# Altium schematic sheet 7''_LCD_Connector.SchDoc
size A4; DocumentNumber: 20; SheetNumber: 20; SheetTotal: 28
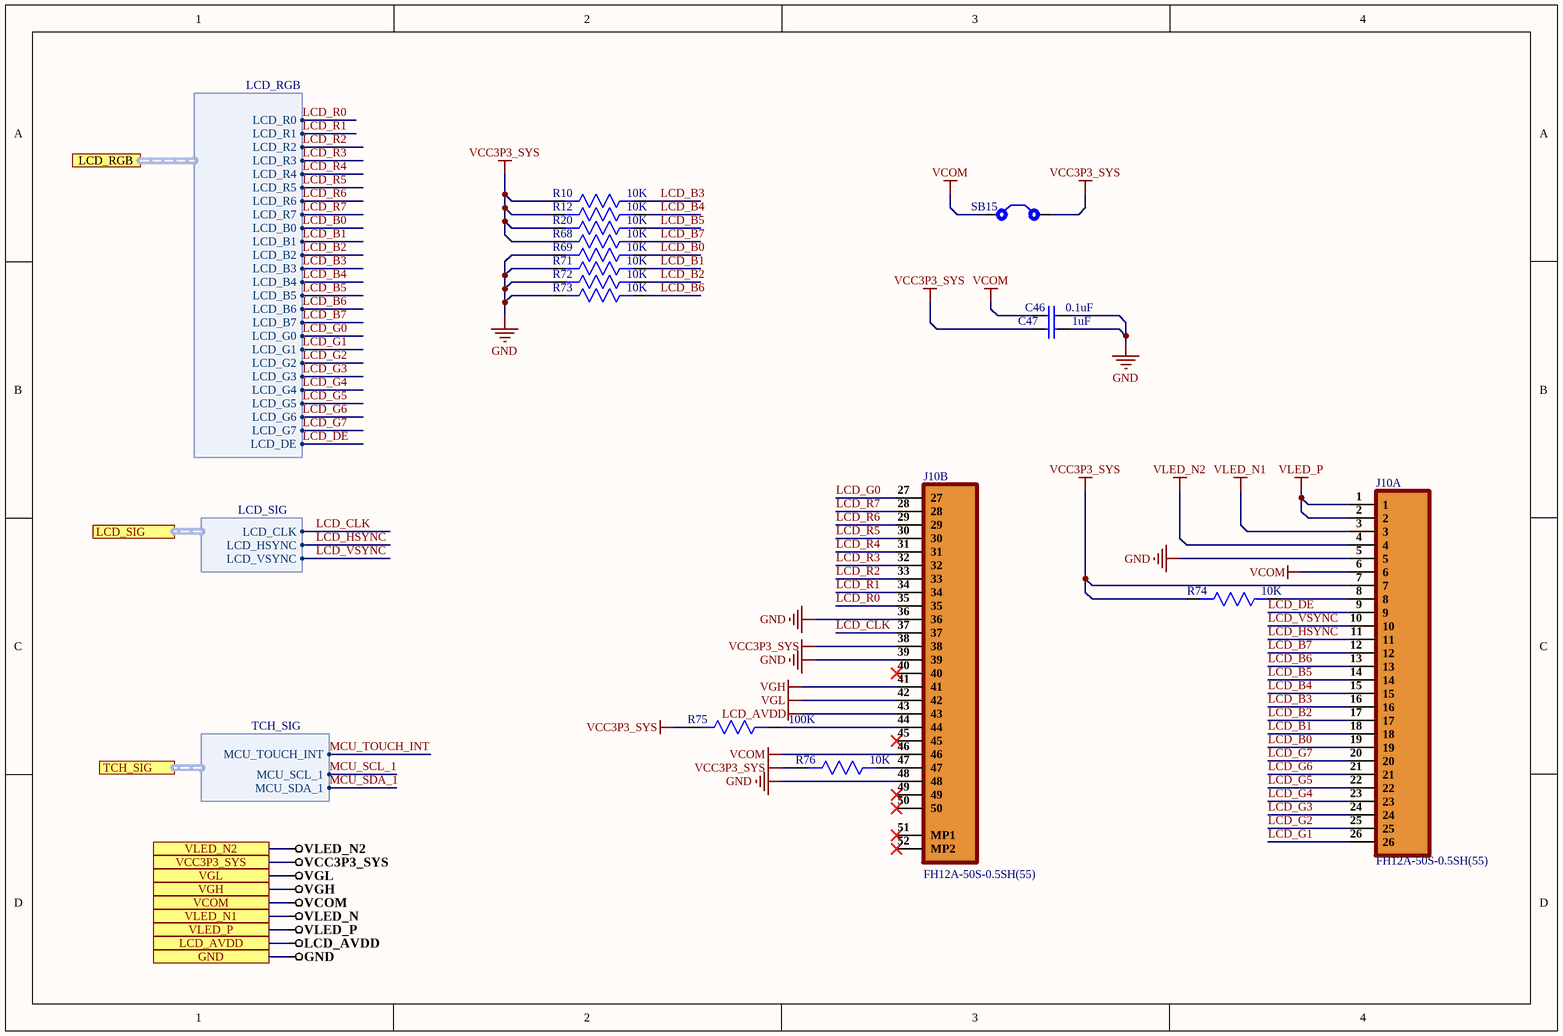
[diagram p0: 7''_LCD_Connector.SchDoc]

## Parts
C46  0.1uF  [Cap0603]
C47  1uF  [Cap0603]
J10  FH12A-50S-0.5SH(55)  [FH12A-50S-0.5SH(55)]  (parts A,B of 2)
R10  10K  [Res0603]
R12  10K  [Res0603]
R20  10K  [Res0603]
R68  10K  [Res0603]
R69  10K  [Res0603]
R71  10K  [Res0603]
R72  10K  [Res0603]
R73  10K  [Res0603]
R74  10K  [Res0603]
R75  100K  [Res0603]
R76  10K  [Res0603]
SB15  Solder Bridge  [Solder Bridge]  (value not drawn)

## Ports
GND, LCD_AVDD, LCD_RGB (harness LCD_RGB), LCD_SIG (harness LCD_SIG), TCH_SIG (harness TCH_SIG), VCC3P3_SYS, VCOM, VGH, VGL, VLED_N1, VLED_N2, VLED_P

## Harnesses
LCD_RGB: LCD_R0, LCD_R1, LCD_R2, LCD_R3, LCD_R5, LCD_R7, LCD_R6, LCD_R4, LCD_B0, LCD_B2, LCD_B4, LCD_B5, LCD_B6, LCD_B7, LCD_B3, LCD_B1, LCD_G0, LCD_G1, LCD_G2, LCD_G3, LCD_G4, LCD_G5, LCD_G6, LCD_G7, LCD_DE
TCH_SIG: MCU_TOUCH_INT, MCU_SCL_1, MCU_SDA_1
LCD_SIG: LCD_CLK, LCD_HSYNC, LCD_VSYNC

## Nets
GND: C46.2 C47.2 J10.5 J10.36 J10.39 J10.48 R69.2 R71.2 R72.2 R73.2 ; port GND
LCD_AVDD: J10.43 ; port LCD_AVDD
VCC3P3_SYS: C47.1 J10.7 J10.38 R10.2 R12.2 R20.2 R68.2 R74.2 R75.2 R76.2 SB15.2 ; port VCC3P3_SYS
VCOM: C46.1 J10.6 J10.46 SB15.1 ; port VCOM
VGH: J10.41 ; port VGH
VGL: J10.42 ; port VGL
VLED_N: port VLED_N1
VLED_N1: J10.3
VLED_N2: J10.4 ; port VLED_N2
VLED_P: J10.1 J10.2 ; port VLED_P
LCD_B0: J10.19 R69.1 ; port LCD_RGB.LCD_B0
LCD_B1: J10.18 R71.1 ; port LCD_RGB.LCD_B1
LCD_B2: J10.17 R72.1 ; port LCD_RGB.LCD_B2
LCD_B3: J10.16 R10.1 ; port LCD_RGB.LCD_B3
LCD_B4: J10.15 R12.1 ; port LCD_RGB.LCD_B4
LCD_B5: J10.14 R20.1 ; port LCD_RGB.LCD_B5
LCD_B6: J10.13 R73.1 ; port LCD_RGB.LCD_B6
LCD_B7: J10.12 R68.1 ; port LCD_RGB.LCD_B7
LCD_CLK: J10.37 ; port LCD_SIG.LCD_CLK
LCD_DE: J10.9 ; port LCD_RGB.LCD_DE
LCD_G0: J10.27 ; port LCD_RGB.LCD_G0
LCD_G1: J10.26 ; port LCD_RGB.LCD_G1
LCD_G2: J10.25 ; port LCD_RGB.LCD_G2
LCD_G3: J10.24 ; port LCD_RGB.LCD_G3
LCD_G4: J10.23 ; port LCD_RGB.LCD_G4
LCD_G5: J10.22 ; port LCD_RGB.LCD_G5
LCD_G6: J10.21 ; port LCD_RGB.LCD_G6
LCD_G7: J10.20 ; port LCD_RGB.LCD_G7
LCD_HSYNC: J10.11 ; port LCD_SIG.LCD_HSYNC
LCD_R0: J10.35 ; port LCD_RGB.LCD_R0
LCD_R1: J10.34 ; port LCD_RGB.LCD_R1
LCD_R2: J10.33 ; port LCD_RGB.LCD_R2
LCD_R3: J10.32 ; port LCD_RGB.LCD_R3
LCD_R4: J10.31 ; port LCD_RGB.LCD_R4
LCD_R5: J10.30 ; port LCD_RGB.LCD_R5
LCD_R6: J10.29 ; port LCD_RGB.LCD_R6
LCD_R7: J10.28 ; port LCD_RGB.LCD_R7
LCD_VSYNC: J10.10 ; port LCD_SIG.LCD_VSYNC
MCU_SCL_1: port TCH_SIG.MCU_SCL_1
MCU_SDA_1: port TCH_SIG.MCU_SDA_1
MCU_TOUCH_INT: port TCH_SIG.MCU_TOUCH_INT
NetJ10_8: J10.8 R74.1
NetJ10_44: J10.44 R75.1
NetJ10_47: J10.47 R76.1

Not connected (* = marked no-connect by the designer): J10 40* 45* 49* 50* 51(MP1)* 52(MP2)*

## Library data of the parts
C46 = CC0603ZRY5V9BB104: CAP CER 0.1UF 50V Y5V 0603; Manufacturer: Yageo; Capacitance: 100nF; Tolerance: 80%; Supplier 1: Digi-Key; Manufacturer Part Number: CC0603ZRY5V9BB104; Stock 1: 15000880; Pricing 1: 1=0.1, 10=0.075, 100=0.0334, 500=0.02386, 1000=0.01874 (USD); Mount: Surface Mount; Case/Package: 0603; Number of Pins: 2; Case Code (Metric): 1608; Case Code (Imperial): 0603; Min Operating Temperature: -30°C; Max Operating Temperature: 85°C; Dielectric: Y5V; Voltage Rating: 50V; Package Quantity: 1; Packaging: Tape and Reel; Voltage Rating (DC): 50V; Termination: SMD/SMT; Composition: Ceramic; Voltage: 50V; Length: 1.6mm; Height: 0.8mm; Width: 0.031inch; Thickness: 0.035inch; Depth: 0.8mm; Radiation Hardening: No; REACH SVHC: No SVHC; Lead Free: Lead Free; Halogen Free: Halogen Free; ComponentLink1URL: http://www.yageo.com/documents/recent/UPY-GPHC_Y5V_6.3V-to-50V_8.pdf?src-supplier=Digi-Key; ComponentLink1Description: http://www.yageo.com/documents/recent/UPY-GPHC_Y5V_6.3V-to-50V_8.pdf?src-supplier=Digi-Key; ComponentLink2URL: http://www.yageo.com/documents/recent/UPY-GPHC_Y5V_6.3V-to-50V_5.pdf?src-supplier=Avnet+Europe; ComponentLink2Description: http://www.yageo.com/documents/recent/UPY-GPHC_Y5V_6.3V-to-50V_5.pdf?src-supplier=Avnet+Europe; ComponentLink3URL: https://www.verical.com/server-webapp/html/getDatasheet?partID=403611&src-supplier=Verical; ComponentLink3Description: https://www.verical.com/server-webapp/html/getDatasheet?partID=403611&src-supplier=Verical; ComponentLink4URL: http://www.mouser.com/ds/2/447/Yageo_UPY-GP_NP0_16V-to-50V_9-358835.pdf?src-supplier=Mouser; ComponentLink4Description: http://www.mouser.com/ds/2/447/Yageo_UPY-GP_NP0_16V-to-50V_9-358835.pdf?src-supplier=Mouser; ComponentLink5URL: http://www.farnell.com/datasheets/1132289.pdf?src-supplier=Element14; ComponentLink5Description: http://www.farnell.com/datasheets/1132289.pdf?src-supplier=Element14; Supplier Part Number 1: 311-1343-1-ND
C47 = CC0603KRX5R8BB105: CAP CER 1UF 25V X5R 0603; Manufacturer: Yageo; Tolerance: 10%; Supplier 1: Digi-Key; Manufacturer Part Number: CC0603KRX5R8BB105; Stock 1: 459947; Pricing 1: 1=0.1, 10=0.076, 100=0.0337, 500=0.0241, 1000=0.01894 (USD); Mount: Surface Mount; Case/Package: 0603; Number of Pins: 2; Case Code (Metric): 1608; Case Code (Imperial): 0603; Min Operating Temperature: -55°C; Max Operating Temperature: 85°C; Capacitance: 1uF; Dielectric: X5R; Package Quantity: 1; Voltage Rating: 25V; Packaging: Tape and Reel; Termination: SMD/SMT; Voltage Rating (DC): 25V; Length: 1.6mm; Height: 0.8mm; Width: 0.031inch; Thickness: 0.035inch; Depth: 0.8mm; Radiation Hardening: No; REACH SVHC: No SVHC; Lead Free: Lead Free; Halogen Free: Halogen Free; ComponentLink1URL: http://www.yageo.com/documents/recent/UPY-GPHC_X5R_4V-to-50V_25.pdf?src-supplier=Digi-Key; ComponentLink1Description: http://www.yageo.com/documents/recent/UPY-GPHC_X5R_4V-to-50V_25.pdf?src-supplier=Digi-Key; ComponentLink2URL: http://www.yageo.com/documents/recent/UPY-GPHC_X5R_4V-to-50V_12.pdf?src-supplier=Avnet+Europe; ComponentLink2Description: http://www.yageo.com/documents/recent/UPY-GPHC_X5R_4V-to-50V_12.pdf?src-supplier=Avnet+Europe; ComponentLink3URL: http://www.farnell.com/datasheets/1525783.pdf?src-supplier=Element14; ComponentLink3Description: http://www.farnell.com/datasheets/1525783.pdf?src-supplier=Element14; ComponentLink4URL: http://www.yageo.com/documents/recent/UPY-GPHC_X5R_4V-to-50V_12.pdf?src-supplier=Avnet; ComponentLink4Description: http://www.yageo.com/documents/recent/UPY-GPHC_X5R_4V-to-50V_12.pdf?src-supplier=Avnet; Supplier Part Number 1: 311-1445-1-ND
J10 = FH12A-50S-0.5SH(55): Conn FFC/FPC 50 POS 0.5mm  SMD T/R; Manufacturer: Hirose; Actuator Material: Polyphenylene; Number of Contacts: 50; Wire/Cable Type: Straight; Gender: Female; Current Rating: 500mA; Voltage Rating: 50V; Contact Resistance: 50mR; Max Current Rating: 400mA; Contact Location: Top; Insulation Resistance: 500MR; Mating Cycles: 20; Supplier 1: Digi-Key; Manufacturer Part Number: FH12A-50S-0.5SH(55); RoHS: Yes; Category: FFC / FPC; Pricing 1: 1=3.00000, 10=2.88000, 25=2.64000, 50=2.52000, 100=2.40000, 250=2.10000, 500=2.04000, 1000=1.74000 (USD); Mount: Surface Mount; Housing Material: Polyamide; Contact Material: Bronze; Contact Plating: Gold; Housing Color: Beige; Material: Polyamide; Color: Beige,Brown; Min Operating Temperature: -40°C; Max Operating Temperature: 70°C; Orientation: Right Angle; Termination: Solder; Number of Rows: 1; Package Quantity: 2000; Packaging: Tape and Reel; Number of Positions: 50; Max Voltage Rating (AC): 50V; Voltage Rating (AC): 50V; Length: 29.5mm; Width: 29.1mm; Pitch: 0.5mm; Depth: 6.2mm; Lead Pitch: 0.5mm; Radiation Hardening: No; Flammability Rating: UL94 V-0; Lead Free: Lead Free; REACH SVHC: No SVHC; ComponentLink1URL: https://datasheet.ciiva.com/14667/0900766b80806912-14667338.pdf?src-supplier=RSComponents; ComponentLink1Description: https://datasheet.ciiva.com/14667/0900766b80806912-14667338.pdf?src-supplier=RSComponents; ComponentLink2URL: https://datasheet.ciiva.com/11745/0900766b80d985fc-11745058.pdf?src-supplier=RSComponents; ComponentLink2Description: https://datasheet.ciiva.com/11745/0900766b80d985fc-11745058.pdf?src-supplier=RSComponents; ComponentLink3URL: https://datasheet.ciiva.com/15176/getdatasheetpartid-447852-15176863.pdf?src-supplier=Verical; ComponentLink3Description: https://datasheet.ciiva.com/15176/getdatasheetpartid-447852-15176863.pdf?src-supplier=Verical; ComponentLink4URL: https://datasheet.ciiva.com/7989/58809-7989413.pdf?src-supplier=Element14; ComponentLink4Description: https://datasheet.ciiva.com/7989/58809-7989413.pdf?src-supplier=Element14; ComponentLink5URL: https://datasheet.ciiva.com/5137/ed-fh12-20140305-355586-5137621.pdf?src-supplier=Mouser; ComponentLink5Description: https://datasheet.ciiva.com/5137/ed-fh12-20140305-355586-5137621.pdf?src-supplier=Mouser; Supplier Part Number 1: HFK150CT-ND
R10 R12 R20 R68 R69 R71-R74 R76 = AC0603JR-0710KL: RES SMD 10K OHM 5% 1/10W 0603; Manufacturer: Yageo; Voltage Rating: 50V; Resistance: 10kR; Power Rating: 100mW; Temperature Coefficient: 100ppm/°C; Supplier 1: Future Electronics; Manufacturer Part Number: AC0603JR-0710KL; RoHS: Yes; Category: Chip SMD Resistors; Stock 1: 1533000; Pricing 1: 5000=0.00540 (USD); Case/Package: 0603; Case Code (Imperial): 0603; Case Code (Metric): 1608; Size Code: 0603; Min Operating Temperature: -55°C; Max Operating Temperature: 155°C; Packaging: Tape and Reel; Tolerance: 5%; Package Quantity: 1; Resistor Type: Thick Film; Termination: SMD/SMT; Number of Terminations: 2; Max Power Dissipation: 100mW; Features: Moisture Resistant,Automotive AEC-Q200,Anti-Sulfur; Series: AC; Construction: Rectangular; Length: 0.063inch; Width: 0.031inch; Height: 0.022inch; Depth: 0.8mm; Military Standard: Not; Lead Free: Lead Free; RoHS Compliant: Yes; ComponentLink1URL: https://datasheet.ciiva.com/5562/pyu-ac-51-rohs-l-2-5562553.pdf?src-supplier=Mouser; ComponentLink1Description: https://datasheet.ciiva.com/5562/pyu-ac-51-rohs-l-2-5562553.pdf?src-supplier=Mouser; Supplier Part Number 1: 1029044
R75 = CRGH0603J100K: RES SMD 100K OHM 5% 1/5W 0603; Manufacturer: TE Connectivity; Resistance: 100kR; Temperature Coefficient: 100ppm/°C; Power Rating: 200mW; Voltage Rating: 50V; Number of Resistors: 1; Supplier 1: Digi-Key; Manufacturer Part Number: CRGH0603J100K; Stock 1: 23277; Pricing 1: 1=0.1, 10=0.049, 100=0.02, 1000=0.00899, 2500=0.0078 (USD); Mount: Surface Mount; Case/Package: 0603; Case Code (Imperial): 0603; Case Code (Metric): 1608; Min Operating Temperature: -55°C; Max Operating Temperature: 125°C; Tolerance: 5%; Packaging: Tape and Reel; Resistor Type: Thick Film,Power resistor; Number of Terminations: 2; Series: CRGH; Termination: Solder; Voltage Rating (DC): 50V; Resistance Tolerance: 5%; Technology: THICK FILM; Length: 1.6mm; Width: 0.8mm; Height: 0.45mm; Depth: 0.8mm; RoHS Compliant: Yes; REACH SVHC: No SVHC; ELV: Compliant; ComponentLink1URL: http://www.farnell.com/datasheets/2007183.pdf?src-supplier=Element14; ComponentLink1Description: http://www.farnell.com/datasheets/2007183.pdf?src-supplier=Element14; Supplier Part Number 1: A126393DKR-ND
SB15 = Solder Bridge: Solder Bridge ON